# EasyEDA Pro project eda_uahyxtbgs-165w-three-way-multi-protocol-fa-dc91a91e.epro, board PCB_嘉立创8838*150mm铝机壳PCB尺寸15*8.4cm
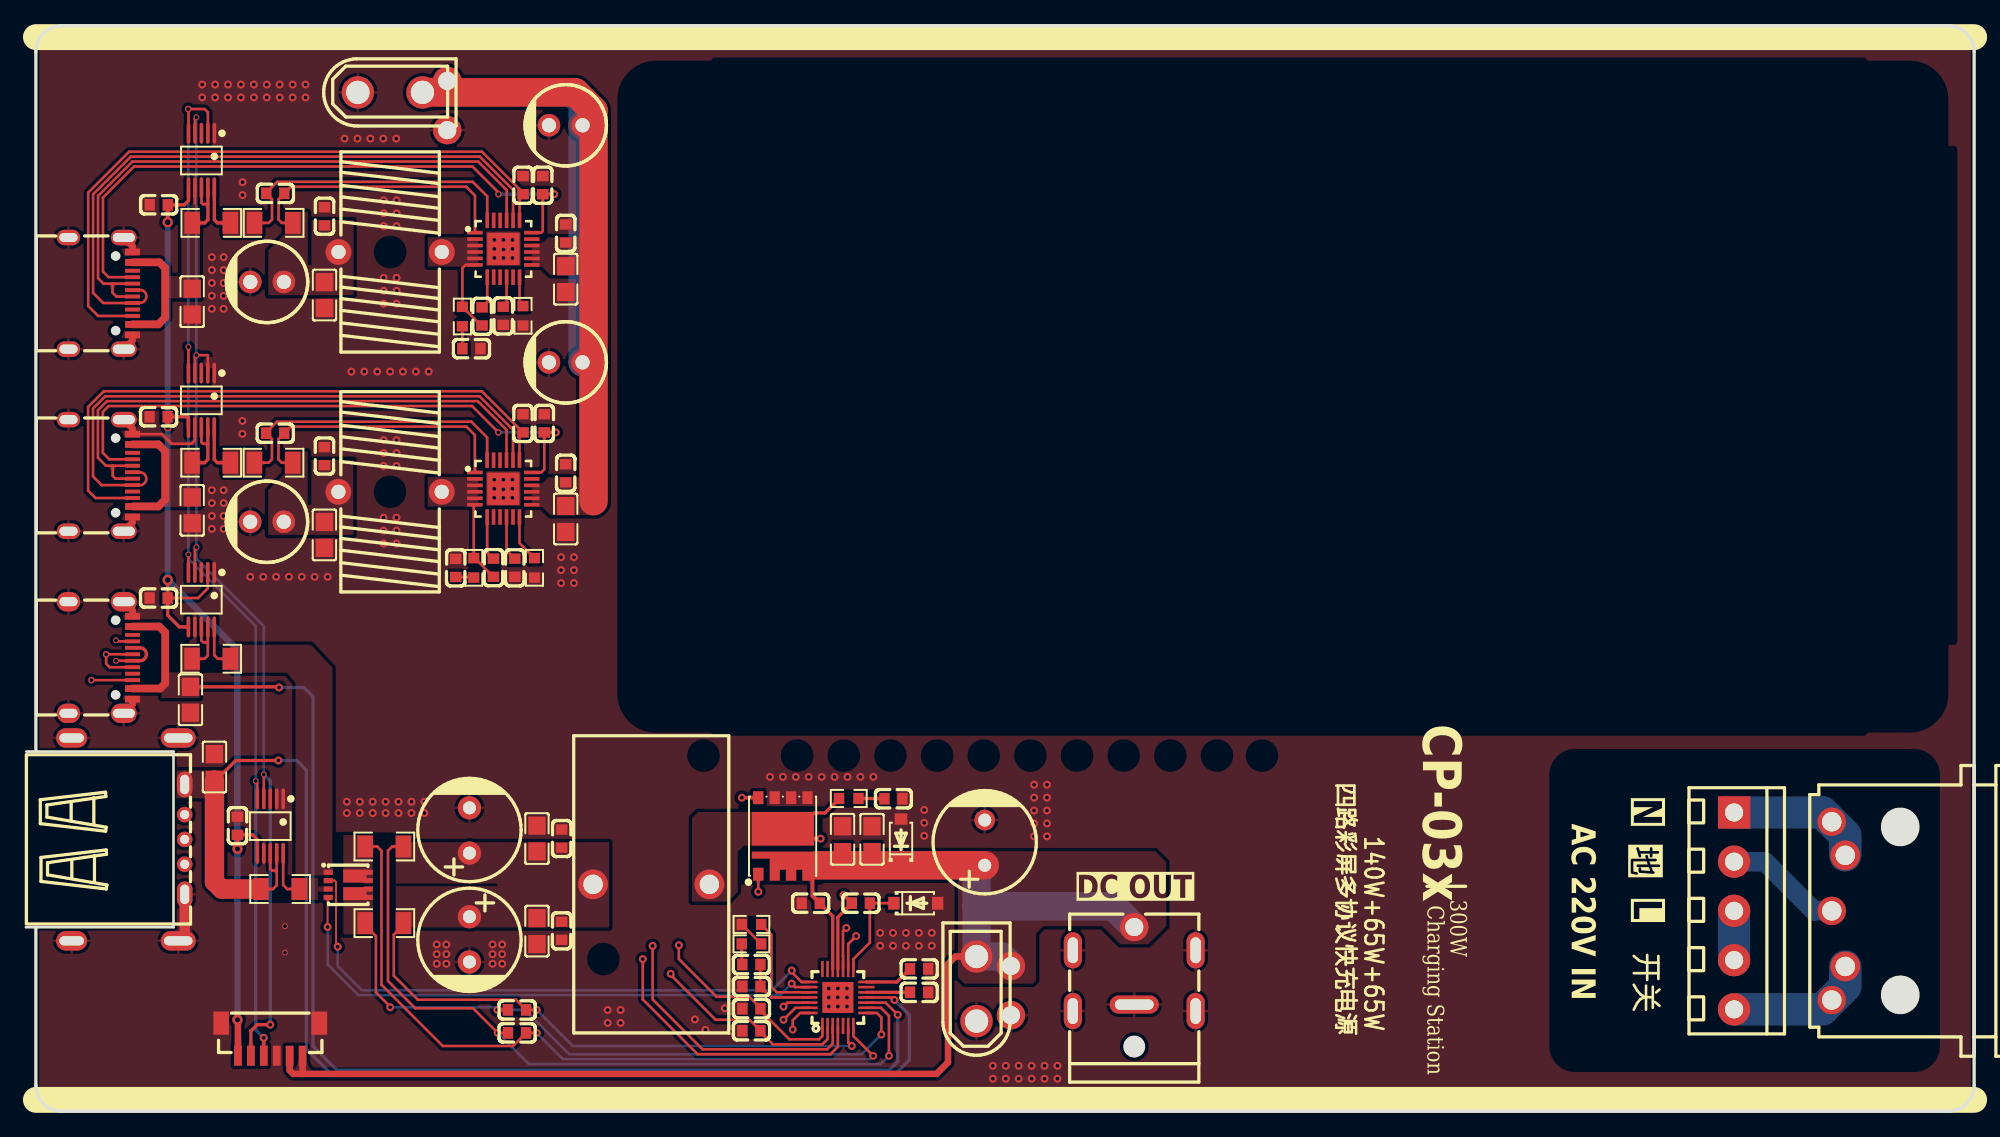
[diagram p4: board, top side]
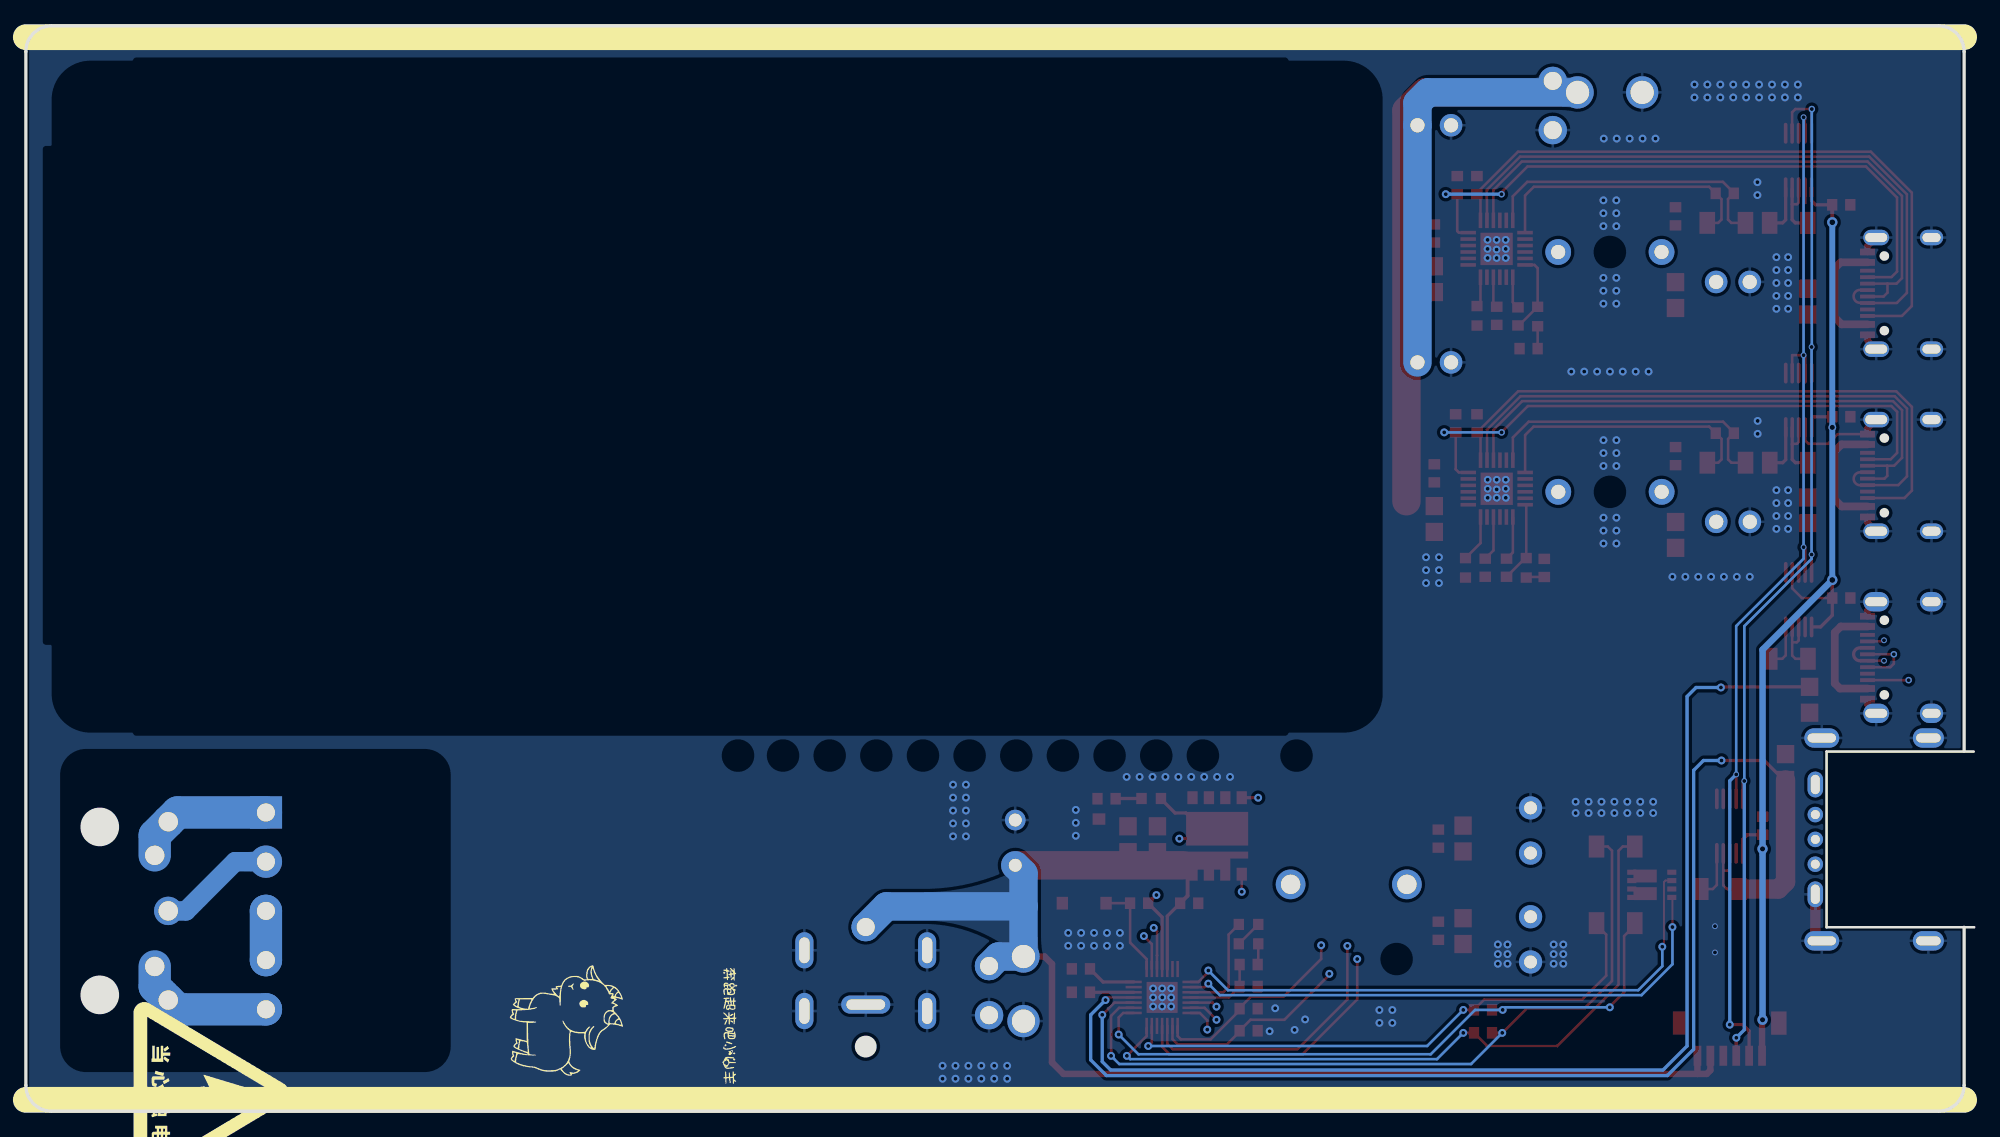
[diagram p5: board, bottom side, seen from below]

Outline 150.78 x 84 mm; copper layers: Top Layer, Inner1, Inner2, Bottom Layer. Coordinates in mm from the lower left corner of the outline.
Outline path: 0.78,27.86 0.78,82 arc(1.36,83.41) 2.78,84 148.78,84 arc(150.19,83.41) 150.78,82 150.78,2 arc(150.19,0.59) 148.78,0 2.78,0 arc(1.36,0.59) 0.78,2 0.78,14.23
Stack: Top Layer 0.035mm 外层铜厚1oz / Dielectric1 0.2104mm 7628 RC49% 8.6mil / Inner1 0.0152mm 内层铜厚 / Dielectric2 1.065mm 1.1mm H/HOZ Copper / Inner2 0.0152mm 内层铜厚 / Dielectric3 0.2104mm 7628 RC49% 8.6mil / Bottom Layer 0.035mm 外层铜厚1oz

## Design rules (mm)
spacing copperThickness1oz: track to track 0.102, other pairs 0.152 to 0.3
spacing copperThickness2oz (default): track to track 0.102, other pairs 0.152 to 0.3
spacing Plane_innerPlane: track to track 0.102, other pairs 0.152 to 0.3
spacing Copper_copperRegion: track to track 0.102, other pairs 0.152 to 0.3
spacing Copper_power: track to track 0.102, other pairs 0.152 to 0.3
track width copperThickness1oz (default): min 0.127, default 0.254, max 6
track width copperThickness2oz: min 0.203, default 0.254, max 2.54
differential pair differentialPair (default): width min 0.127, default 0.254, max 2.54; gap min 0.152, default 0.152
region e1 uses Copper_copperRegion
region e2 uses Copper_copperRegion
region e3 uses Copper_copperRegion
region e4 uses Copper_copperRegion
region e5 uses Copper_copperRegion
region e6 uses Copper_copperRegion
region e7 uses Copper_copperRegion
region e8 uses Copper_copperRegion
region e9 uses Copper_copperRegion
region e10 uses Copper_copperRegion
region e11 uses Copper_copperRegion
region e12 uses Copper_copperRegion
region e13 uses Copper_copperRegion
region e14 uses Copper_copperRegion
region e15 uses Copper_copperRegion
region e16 uses Copper_copperRegion
region e17 uses Copper_copperRegion
region e18 uses Copper_copperRegion
region e19 uses Copper_copperRegion
region e20 uses Copper_copperRegion
region e21 uses Copper_copperRegion
region e22 uses Copper_copperRegion
region e23 uses Copper_copperRegion
region e24 uses Copper_copperRegion
region e25 uses Copper_copperRegion
region e26 uses Copper_copperRegion
region e27 uses Copper_copperRegion
region e28 uses Copper_copperRegion
region e29 uses Copper_copperRegion
region e30 uses Copper_copperRegion
region e31 uses Copper_copperRegion
region e32 uses Copper_copperRegion
region e33 uses Copper_copperRegion
region e34 uses Copper_copperRegion
region e35 uses Copper_copperRegion
region e36 uses Copper_copperRegion
region e37 uses Copper_copperRegion
region e38 uses Copper_copperRegion
region e39 uses Copper_copperRegion
region e40 uses Copper_copperRegion
region e41 uses Copper_copperRegion
region e42 uses Copper_copperRegion
region e43 uses Copper_copperRegion
region e44 uses Copper_copperRegion
region e45 uses Copper_copperRegion
region e46 uses Copper_copperRegion
region e47 uses Copper_copperRegion
region e48 uses Copper_copperRegion
region e49 uses Copper_copperRegion
region e50 uses Copper_copperRegion
region e51 uses Copper_copperRegion
region e52 uses Copper_copperRegion
region e53 uses Copper_copperRegion
region e54 uses Copper_copperRegion
region e55 uses Copper_copperRegion
region e56 uses Copper_copperRegion
region e57 uses Copper_copperRegion
region e58 uses Copper_copperRegion
region e59 uses Copper_copperRegion
region e60 uses Copper_copperRegion
region e61 uses Copper_copperRegion
region e62 uses Copper_copperRegion
region e63 uses Copper_copperRegion
region e64 uses Copper_copperRegion
region e65 uses Copper_copperRegion
region e66 uses Copper_copperRegion
region e67 uses Copper_copperRegion
region e68 uses Copper_copperRegion
region e69 uses Copper_copperRegion
region e70 uses Copper_copperRegion
region e71 uses Copper_copperRegion
region e72 uses Copper_copperRegion
region e73 uses Copper_copperRegion
region e74 uses Copper_copperRegion
region e75 uses Copper_copperRegion
region e76 uses Copper_copperRegion
region e77 uses Copper_copperRegion
region e78 uses Copper_copperRegion
region e79 uses Copper_copperRegion
region e80 uses Copper_copperRegion
region e81 uses Copper_copperRegion
region e82 uses Copper_copperRegion
region e83 uses Copper_copperRegion
region e84 uses Copper_copperRegion
region e85 uses Copper_copperRegion
region e86 uses Copper_copperRegion
region e87 uses Copper_copperRegion
region e88 uses Copper_copperRegion
region e89 uses Copper_copperRegion
region e90 uses Copper_copperRegion
region e91 uses Copper_copperRegion
region e92 uses Copper_copperRegion
region e93 uses Copper_copperRegion
region e94 uses Copper_copperRegion
region e95 uses Copper_copperRegion
region e96 uses Copper_copperRegion
region e97 uses Copper_copperRegion
region e98 uses Copper_copperRegion
region e99 uses Copper_copperRegion
region e100 uses Copper_copperRegion
region e101 uses Copper_copperRegion
region e102 uses Copper_copperRegion
region e103 uses Copper_copperRegion
region e104 uses Copper_copperRegion
region e105 uses Copper_copperRegion
region e106 uses Copper_copperRegion
region e107 uses Copper_copperRegion
region e108 uses Copper_copperRegion
region e109 uses Copper_copperRegion
region e110 uses Copper_copperRegion
region e111 uses Copper_copperRegion
region e112 uses Copper_copperRegion
region e113 uses Copper_copperRegion
region e114 uses Copper_copperRegion
region e115 uses Copper_copperRegion
region e116 uses Copper_copperRegion
region e117 uses Copper_copperRegion
region e118 uses Copper_copperRegion
region e119 uses Copper_copperRegion
region e120 uses Copper_copperRegion
region e121 uses Copper_copperRegion
region e122 uses Copper_copperRegion
region e123 uses Copper_copperRegion
pour e1064 uses Copper_copperRegion
pour e1172 uses Copper_copperRegion
pour e1284 uses Copper_copperRegion

## Placement (name value [footprint] x y rotation side)
C1  100pF  [C0603]  56.15 9.64 180 top
C2  2.2nF  [C0603_4]  56.15 11.35 180 top
C3  100nF  [C0603_1]  60.75 16.09 0 top
C4  22uF  [C0805]  65.48 21.04 270 top
C5  330pF  [C0603]  56.15 7.93 180 top
C6  22uF  [C0805]  41.78 45.83 90 top
C7  330pF  [C0603]  56.15 6.23 180 top
C8  100nF  [C0603_1]  64.62 16.1 180 top
C9  100nF  [C0603_1]  41.47 21.09 270 top
C10  22uF  [C0805]  39.56 21.1 270 top
C11  10uF  [C0805]  14.6 26.63 270 top
C12  1uF  [C0603]  69.13 9.2 180 top
C13  1uF  [C0603]  69.13 11.01 180 top
C14  10uF  [C0805]  12.74 31.84 90 top
C15  100nF  [C0603_1]  38.01 7.84 180 top
C16  100nF  [C0603_1]  38.01 6.06 180 top
C17  330pF  [C0603]  38.47 53.24 90 top
C18  330pF  [C0603]  40.12 53.24 90 top
C19  100nF  [C0603_1]  41.78 49.37 270 top
C20  100nF  [C0603_1]  36.19 42.06 270 top
C21  1uF  [C0603]  37.84 42.06 90 top
C22  2.2nF  [C0603_1]  33.27 42.04 270 top
C23  100nF  [C0603_1]  23.11 50.7 270 top
C24  22uF  [C0805]  23.11 44.6 90 top
C25  100nF  [C0603_1]  19.3 52.47 180 top
C26  10uF  [C0805]  12.87 46.5 90 top
C32  2.2nF  [C0603_4]  67.14 24.18 180 top
C33  22uF  [C0805]  39.56 13.94 90 top
C34  100nF  [C0603_1]  41.47 13.96 90 top
C35  22uF  [C0805]  63.2 21.04 270 top
C36  100nF  [C0603_1]  23.11 69.26 270 top
C37  100nF  [C0603_1]  19.3 71.04 180 top
C38  10uF  [C0805]  12.87 62.65 90 top
C39  100nF  [C0603_1]  35.31 61.51 270 top
C40  1uF  [C0603]  36.95 61.56 90 top
C41  100nF  [C0603_1]  41.78 67.93 270 top
C42  330pF  [C0603]  38.48 71.67 90 top
C43  330pF  [C0603]  40 71.67 90 top
C44  2.2nF  [C0603_1]  34.48 59.02 180 top
C45  22uF  [C0805]  41.78 64.39 90 top
C46  22uF  [C0805]  23.11 63.16 90 top
C47  100nF  [C0603_1]  10.28 53.74 0 top
C48  100nF  [C0603_1]  10.29 70.15 0 top
C49  100nF  [C0603_1]  10.28 39.71 0 top
C50  100nF  [C0603_1]  16.38 22.09 270 top
CN2  DB-6-1P4P3  [CONN-TH_DB-6-1P4P3]  139.76 15.5 90 top
CN3  XT30UPB-M  [CONN-TH_XT30UPB-M]  28.19 78.85 0 top
CN5  DB125-3.81-5P-GN-S  [CONN-TH_DB125-3.81-5P-GN-S]  132.2 15.5 270 top
EC1  220uF  [CAP-TH_BD8.0-P3.50-D0.6-FD-2]  74.21 20.78 90 top
EC2  100uF  [CAP-TH_BD8.0-P3.50-D0.6-FD]  34.33 21.72 90 top
EC3  100uF  [CAP-TH_BD8.0-P3.50-D0.6-FD]  34.33 13.3 270 top
EC4  220uF  [CAP-TH_BD6.3-P2.60-D0.6-FD-1]  41.78 57.95 180 top
EC5  220uF  [CAP-TH_BD6.3-P2.60-D0.6-FD-1]  18.66 45.62 180 top
EC6  220uF  [CAP-TH_BD6.3-P2.60-D0.6-FD-1]  18.67 64.18 180 top
EC7  220uF  [CAP-TH_BD6.3-P2.60-D0.6-FD-1]  41.78 76.3 180 top
J1  U263-163N-4OS1735  [USB-C-SMD_U263-163N-4GS1735]  5.78 35.11 270 top
J2  U224-051N-3GRA035  [USB-A-TH_U224-051N-3GRA035]  7.84 21.03 270 top
J3  U263-163N-4BLS1735  [USB-C-SMD_U263-163N-4GS1735#2]  5.78 49.2 270 top
J4  U263-163N-4BLS1735  [USB-C-SMD_U263-163N-4GS1735#2]  5.78 63.3 270 top
L1  22uH  [IND-TH_L23.0-W12.0-P9.00-D1.3]  48.4 17.55 90 top
L3  22uH  [IND-TH_L15.5-W7.5-P8.00-D0.8]  28.19 47.93 90 top
L4  22uH  [IND-TH_L15.5-W7.5-P8.00-D0.8]  28.19 66.5 90 top
NOREF  -  [Pad_e377]  32.61 79.74 0 top
NOREF#2  -  [Pad_e375]  76.24 11.24 0 top
NOREF#3  -  [Pad_e378]  32.61 75.93 0 top
NOREF#4  -  [Pad_e374]  140.8 11.2 0 top
NOREF#5  -  [Pad_e373]  140.8 19.8 0 top
NOREF#6  -  [Pad_e376]  76.24 7.43 0 top
Q1  RUH30J51M  [DFN-8_L6.0-W5.0-P1.27_AON6938]  58.59 21.3 0 top
Q4  ESN4838  [DFN-8_L3.0-W3.0-P0.65-LS3.4-BL]  24.95 17.52 270 top
R1  20kΩ  [R0603]  56.16 12.95 180 top
R2  SDNT1608X103F3380FTF  [R0603_1]  56.16 14.45 0 top
R7  33kΩ  [R0603]  39.36 42.05 90 top
R8  2Ω  [R0603_1]  34.66 42.05 90 top
R9  5mΩ  [R1206]  27.74 20.48 180 top
R11  5mΩ  [R1206]  27.74 14.55 180 top
R12  10mΩ  [R1206]  19.17 50.19 180 top
R20  2Ω  [R0603_1]  63.69 24.2 180 top
R21  10mΩ  [R1206]  19.18 68.75 180 top
R22  33kΩ  [R0603]  38.47 61.56 90 top
R23  2Ω  [R0603_1]  33.78 61.5 90 top
R24  5mΩ  [R1206]  14.34 50.19 180 top
R25  5mΩ  [R1206]  14.35 68.75 180 top
R26  5mΩ  [R1206]  19.68 17.19 0 top
R27  5mΩ  [R1206]  14.34 35.02 0 top
T1  SMF30A  [SOD-123_L2.6-W1.6-LS3.5-RD]  68.87 16.09 0 top
T2  SMF30A  [SOD-123_L2.6-W1.6-LS3.5-RD]  67.73 20.92 90 top
U1  SW3526  [QFN-24_L4.0-W4.0-P0.50-TL-EP2.5]  36.95 48.18 0 top
U2  SW3538  [QFN-28_L4.0-W4.0-P0.40-TL-EP2.4]  62.84 8.8 90 top
U4  XT30UPB-M  [CONN-TH_XT30UPB-M]  73.57 9.47 90 top
U5  HX DC007B-2.0-J  [DC-IN-TH_HX-DC007B-2.5]  85.78 11 90 top
U7  INA226AIDGSR  [MSOP-10_L3.0-W3.0-P0.50-LS5.0-BL]  18.92 22.06 180 top
U8  INA226AIDGSR  [MSOP-10_L3.0-W3.0-P0.50-LS5.0-BL]  13.58 55.01 180 top
U9  INA226AIDGSR  [MSOP-10_L3.0-W3.0-P0.50-LS5.0-BL]  13.58 39.59 180 top
U10  INA226AIDGSR  [MSOP-10_L3.0-W3.0-P0.50-LS5.0-BL]  13.59 73.58 180 top
U11  SW3526  [QFN-24_L4.0-W4.0-P0.50-TL-EP2.5]  36.96 66.75 0 top
U12  X1002WVS-06E-LPSWHF  [CONN-SMD_6P-P1.00_X1002WVS-06E-LPSWHF]  18.92 5.55 180 top

## Footprints (pads in the part's own frame, mm; a bottom-side part is the same pattern mirrored in y, then rotated)
C0603
  rect 0.8x0.9 smd: 1(-0.7,0) 2(0.7,0)
C0603_1
  rect 0.8x0.9 smd: 1(-0.7,0) 2(0.7,0)
C0603_4
  rect 0.8x0.9 smd: 1(-0.7,0) 2(0.7,0)
C0805
  rect 1.41x1.35 smd: 1(-1,0) 2(1,0)
CAP-TH_BD6.3-P2.60-D0.6-FD-1
  round 1.75 hole 1.1: 1(-1.3,0) 2(1.3,0)
CAP-TH_BD8.0-P3.50-D0.6-FD
  round 1.8 hole 1: 1(-1.75,0) 2(1.75,0)
CAP-TH_BD8.0-P3.50-D0.6-FD-2
  round 1.6 hole 1: 1(-1.75,0) 2(1.75,0)
CONN-SMD_6P-P1.00_X1002WVS-06E-LPSWHF
  rect 0.6x1.55 smd: 1(2.5,1.262) 2(1.5,1.262) 3(0.5,1.262) 4(-0.5,1.262) 5(-1.5,1.262) 6(-2.5,1.262)
  rect 1.2x1.8 smd: 7(-3.8,-1.262) 8(3.8,-1.262)
CONN-TH_DB125-3.81-5P-GN-S
  rect 2.5x2.5 hole 1.4: 1(-7.62,0)
  round 2.5 hole 1.4: 2(-3.81,0) 3(0,0) 4(3.81,0) 5(7.62,0)
CONN-TH_DB-6-1P4P3
  round 2.2 hole 1.5: 1(-6.9,0) 2(0,0) 3(6.9,0)
CONN-TH_XT30UPB-M
  round 2.5 hole 1.8: 1(-2.5,0) 2(2.5,0)
DC-IN-TH_HX-DC007B-2.5
  round 2.2 hole 1.4: 1(3.25,0)
  oval 1.4x3.8 hole 0.8x3: 2(-2.75,0)
  oval 2.8x1.4 hole 2x0.8: 3(-3.25,4.75) 3(-3.25,-4.75) 3(1.45,4.75) 3(1.45,-4.75)
DFN-8_L3.0-W3.0-P0.65-LS3.4-BL
  rect 0.4x0.7 smd: 1(-0.975,-1.55) 2(-0.325,-1.55) 3(0.325,-1.55) 4(0.975,-1.55) 5(0.975,1.55) 6(0.325,1.55) 7(-0.325,1.55) 8(-0.975,1.55)
  rect 1x1.8 smd: 6(0.68,0.515) 8(-0.68,0.515)
DFN-8_L6.0-W5.0-P1.27_AON6938
  rect 0.8x1 smd: 1(-1.905,-2.96) 3(1.905,2.96) 4(0.635,2.96) 5(-0.635,2.96) 6(-1.905,2.96)
  custom 4.8x2.25 smd: 2(-0.005,-1.91)
  rect 4.8x2.6 smd: 7(0,0.56)
IND-TH_L15.5-W7.5-P8.00-D0.8
  round 2 hole 1.1: 1(0,-4) 2(0,4)
IND-TH_L23.0-W12.0-P9.00-D1.3
  round 2.3 hole 1.5: 1(0,-4.5) 2(0,4.5)
MSOP-10_L3.0-W3.0-P0.50-LS5.0-BL
  oval 0.28x1.62 smd: 1(-1,-2.11) 2(-0.5,-2.11) 3(0,-2.11) 4(0.5,-2.11) 5(1,-2.11) 6(1,2.11) 7(0.5,2.11) 8(0,2.11) 9(-0.5,2.11) 10(-1,2.11)
Pad_e373
  round 2.3 hole 1.5: 1(0,0)
Pad_e374
  round 2.3 hole 1.5: 1(0,0)
Pad_e375
  round 2.2 hole 1.4: 1(0,0)
Pad_e376
  round 2.2 hole 1.4: 1(0,0)
Pad_e377
  round 2.2 hole 1.4: 1(0,0)
Pad_e378
  round 2.2 hole 1.4: 1(0,0)
QFN-24_L4.0-W4.0-P0.50-TL-EP2.5
  rect 1.2x0.28 smd: 1(-2.2,1.25) 2(-2.2,0.75) 3(-2.2,0.25) 4(-2.2,-0.25) 5(-2.2,-0.75) 6(-2.2,-1.25) 13(2.2,-1.25) 14(2.2,-0.75) 15(2.2,-0.25) 16(2.2,0.25) 17(2.2,0.75) 18(2.2,1.25)
  rect 0.28x1.2 smd: 7(-1.25,-2.2) 8(-0.75,-2.2) 9(-0.25,-2.2) 10(0.25,-2.2) 11(0.75,-2.2) 12(1.25,-2.2) 19(1.25,2.2) 20(0.75,2.2) 21(0.25,2.2) 22(-0.25,2.2) 23(-0.75,2.2) 24(-1.25,2.2)
  rect 2.5x2.5 smd: 25(-0.001,-0.013)
QFN-28_L4.0-W4.0-P0.40-TL-EP2.4
  rect 1.25x0.2 smd: 1(-2.2,1.2) 2(-2.2,0.8) 3(-2.2,0.4) 4(-2.2,0.001) 5(-2.2,-0.4) 6(-2.2,-0.8) 7(-2.2,-1.2) 15(2.2,-1.2) 16(2.2,-0.8) 17(2.2,-0.4) 18(2.2,0) 19(2.2,0.4) 20(2.2,0.8) 21(2.2,1.2)
  rect 0.2x1.25 smd: 8(-1.2,-2.2) 9(-0.8,-2.2) 10(-0.4,-2.2) 11(0,-2.2) 12(0.4,-2.2) 13(0.8,-2.2) 14(1.2,-2.2) 22(1.2,2.2) 23(0.8,2.2) 24(0.4,2.2) 25(0,2.2) 26(-0.4,2.2) 27(-0.8,2.2) 28(-1.2,2.2)
  rect 2.4x2.4 smd: 29(0,-0.001)
R0603
  rect 0.806x0.864 smd: 1(-0.753,0) 2(0.753,0)
R0603_1
  rect 0.806x0.864 smd: 1(-0.753,0) 2(0.753,0)
R1206
  rect 1.208x1.701 smd: 1(-1.479,0) 2(1.479,0)
SOD-123_L2.6-W1.6-LS3.5-RD
  rect 0.88x0.99 smd: 1(-1.692,0) 2(1.692,0)
USB-A-TH_U224-051N-3GRA035
  oval 2x1.2 hole 1.5x0.7: 1(-4.25,4.45) 5(4.25,4.45)
  round 1.2 hole 0.7: 2(-1.92,4.45) 3(0,4.45) 4(1.92,4.45)
  oval 1.5x2.7 hole 0.7x2.2: 6(-7.85,3.95) 7(7.85,3.95)
  oval 1.5x2.4 hole 0.7x1.9: 8(-7.85,-4.3) 9(7.85,-4.3)
USB-C-SMD_U263-163N-4GS1735
  rect 0.5x1.15 smd: A1(-3.2,2.478) A4(-2.4,2.478) A9(2.4,2.478) A12(3.219,2.478) B1(3.219,2.478) B4(2.4,2.478) B9(-2.4,2.478) B12(-3.2,2.478)
  rect 0.3x1.15 smd: A5(-1.25,2.478) A6(-0.25,2.478) A7(0.25,2.478) A8(1.25,2.478) B5(1.75,2.478) B6(0.75,2.478) B7(-0.75,2.478) B8(-1.75,2.478)
  oval 1.5x2 hole 0.7x1.7: SH1(-4.32,1.802) SH1(4.32,1.802)
  oval 1.5x1.8 hole 0.7x1.4: SH1(-4.32,-2.478) SH1(4.32,-2.478)
USB-C-SMD_U263-163N-4GS1735#2
  rect 0.5x1.15 smd: A1(-3.2,2.478) A4(-2.4,2.478) A9(2.4,2.478) A12(3.219,2.478) B1(3.219,2.478) B4(2.4,2.478) B9(-2.4,2.478) B12(-3.2,2.478)
  rect 0.3x1.15 smd: A5(-1.25,2.478) A6(-0.25,2.478) A7(0.25,2.478) A8(1.25,2.478) B5(1.75,2.478) B6(0.75,2.478) B7(-0.75,2.478) B8(-1.75,2.478)
  oval 1.2x2 hole 0.7x1.7: SH1(-4.32,1.802) SH1(4.32,1.802)
  oval 1.2x1.8 hole 0.7x1.4: SH1(-4.32,-2.478) SH1(4.32,-2.478)

## Nets
As in the schematic, except:
GND: C1.2 C3.1 C4.1 C5.2 C6.1 C7.2 C9.1 C10.1 C11.1 C12.1 C13.1 C14.1 C17.2 C18.2 C19.1 C21.1 C22.1 C23.1 C24.1 C26.1 C32.1 C33.1 C34.1 C35.1 C36.1 C38.1 C40.1 C41.1 C42.2 C43.2 C44.1 C45.1 C46.1 C47.1 C48.1 C49.1 C50.1 CN3.1 EC1.2 EC2.2 EC3.2 EC4.2 EC5.2 EC6.2 EC7.2 J1.A1 J1.A12 J1.B1 J1.B12 J1.SH1 J2.5 J2.6 J2.7 J2.8 J2.9 J3.A1 J3.A12 J3.B1 J3.B12 J3.SH1 J4.A1 J4.A12 J4.B1 J4.B12 J4.SH1 NOREF#3.1 NOREF#6.1 Q1.3 Q1.4 Q1.5 R1.1 R2.1 R7.1 R22.1 T1.2 T2.2 U1.25 U2.29 U4.1 U5.2 U5.3 U7.1 U7.2 U7.7 U8.1 U8.7 U9.1 U9.7 U10.1 U10.7 U11.25 U12.4 U12.7 U12.8
VIN: C3.2 C4.2 C35.2 EC1.1 NOREF#2.1 Q1.2 T2.1 U2.19 U4.2 U5.1 U12.5 U12.6
VIN2: C6.2 C19.2 C41.2 C45.2 CN3.2 EC4.1 EC7.1 NOREF.1 U1.13 U1.14 U1.15 U1.16 U11.13 U11.14 U11.15 U11.16
LIN: CN2.1 CN5.5 NOREF#4.1
N: CN2.3 CN5.1 NOREF#5.1

Pads without a net: J1 A8 B8; J3 A8 B8; J4 A8 B8; U1 8 9 11 17 22 23; U2 5 13 20 21; U7 3; U8 3; U9 3; U10 3; U11 8 9 11 17 22 23

## Via types
v1: diameter 0.61, hole 0.305, Top Layer to Bottom Layer, 228 vias
v2: diameter 0.45, hole 0.305, Top Layer to Bottom Layer, 11 vias
v3: diameter 0.508, hole 0.305, Top Layer to Bottom Layer, 5 vias
v4: diameter 0.8, hole 0.45, Top Layer to Bottom Layer, 2 vias
v5: diameter 0.8, hole 0.4, Top Layer to Bottom Layer, 2 vias
v6: diameter 0.6, hole 0.4, Top Layer to Bottom Layer, 1 via

## Routing (per net, layer and track width the routed paths; a pad name or vN(x,y) marks a point on that pad's centre or on a via; arc(x,y) is an arc through that point)
3V3: length 87.3
  Top Layer w0.2: 10.98,39.71 13.33,39.71 14.08,40.47 U9.2
  Top Layer w0.254: 10.98,53.74 12.51,53.74 12.58,53.67 U8.6 ; U9.6 11.88,37.48 10.98,38.38 v4(10.98,41.11) ; U7.6 17.92,21.03 17.55,21.39 C50.2 ; C48.2 12.26,70.15 12.59,70.47 U10.6
  Top Layer w0.3: C50.2 16.38,21.39 v5(16.38,20.3) ; v4(10.98,68.8) 10.99,68.8 C48.2 ; v6(10.98,52.92) 10.98,53.74
  Top Layer w0.5: U12.1 16.42,7.03 16.38,7.07
  Bottom Layer w0.45: v4(10.98,68.8) v6(10.98,52.92) v4(10.98,41.11)
  Bottom Layer w0.5: v4(10.98,41.11) 16.38,35.72 16.38,20.3 v5(16.38,20.3) 16.38,7.08 16.38,7.07
  vias: v5(16.38,7.07)
GND: length 21.7
  Top Layer w0.2: 13.07,70.28 13.07,71.45 U10.7 ; R2.1 56.9,12.95 R1.1 ; J3.A1 10.54,52.4 11.3,51.65 12.82,51.65 13.08,51.91 U8.7
  Top Layer w0.5: J1.SH1 8.26,38.75 J1.A1 ; J1.A12 8.26,31.47 J1.SH1 ; J4.SH1 8.26,59.65 J4.A12 ; J3.A12 8.26,45.56 J3.SH1 ; J3.SH1 8.26,52.85 J3.A1 ; J4.A1 8.26,66.94 J4.SH1
  Top Layer w0.8: J2.5 12.29,13.68 J2.7
  vias: v1(13.65,79.46) v1(13.65,78.46) v1(14.4,66.1) v1(14.4,65.1) v1(14.4,64.1) v1(14.4,63.1) v1(14.4,62.1) v1(14.4,48.06) v1(14.4,47.06) v1(14.4,46.06) v1(14.4,45.06) v1(14.65,79.46) v1(14.65,78.46) v1(15.31,66.1) v1(15.31,65.1) v1(15.31,64.1) v1(15.31,63.1) v1(15.31,62.1) v1(15.31,48.06) v1(15.31,47.06) v1(15.31,46.06) v1(15.31,45.06) v1(15.65,79.46) v1(15.65,78.46) v1(16.65,79.46) v1(16.65,78.46) v1(16.77,71.9) v1(16.77,70.9) v1(16.76,53.42) v1(16.76,52.42) v1(17.37,41.36) v1(17.65,79.46) v1(17.65,78.46) v1(18.37,41.36) v1(18.65,79.46) v1(18.65,78.46) v1(19.37,41.36) v1(19.65,79.46) v1(19.65,78.46) v1(20.36,41.36) v1(20.65,79.46) v1(20.65,78.46) v1(21.35,41.36) v1(21.65,79.46) v1(21.65,78.46) v1(22.35,41.36) v1(23.35,41.36) v1(24.66,75.27) v1(24.84,23.95) v1(24.84,23.07) v1(25.19,57.24) v1(25.66,75.27) v1(25.84,23.95) v1(25.84,23.07) v1(26.19,57.24) v1(26.66,75.27) v1(26.84,23.95) v1(26.84,23.07) v1(27.19,57.24) v1(27.66,75.27) v1(27.69,70.5) v1(27.69,69.5) v1(27.69,68.5) v1(27.69,64.5) v1(27.69,63.5) v1(27.69,62.5) v1(27.69,51.93) v1(27.69,50.93) v1(27.69,49.93) v1(27.69,45.93) v1(27.69,44.93) v1(27.69,43.93) v1(27.84,23.95) v1(27.84,23.07) v1(28.19,57.24) v1(28.66,75.27) v1(28.69,70.5) v1(28.69,69.5) v1(28.69,68.5) v1(28.69,64.5) v1(28.69,63.5) v1(28.69,62.5) v1(28.69,51.93) v1(28.69,50.93) v1(28.69,49.93) v1(28.69,45.93) v1(28.69,44.93) v1(28.69,43.93) v1(28.84,23.95) v1(28.84,23.07) v1(29.18,57.24) v1(29.84,23.95) v1(29.84,23.07) v1(30.18,57.24) v1(30.84,23.95) v1(30.84,23.07) v1(31.18,57.24) v1(31.8,12.9) v1(31.8,12.16) v1(31.8,11.41) v1(32.54,12.9) v1(32.54,12.16) v1(32.54,11.41) v1(36.12,12.9) v1(36.12,12.16) v1(36.12,11.41) v1(36.26,67.43) v1(36.26,66.73) v1(36.26,66.03) v1(36.25,48.87) v1(36.25,48.17) v1(36.25,47.47) v1(36.86,12.9) v1(36.86,12.16) v1(36.86,11.41) v1(36.96,67.43) v1(36.96,66.68) v1(36.96,66.03) v1(36.95,48.87) v1(36.95,48.12) v1(36.95,47.47) v1(37.66,67.43) v1(37.66,66.73) v1(37.66,66.03) v1(37.65,48.87) v1(37.65,48.17) v1(37.65,47.47) v1(41.42,42.87) v1(41.42,41.87) v1(41.42,40.87) v1(42.42,42.87) v1(42.42,41.87) v1(42.42,40.87) v1(45.03,7.83) v1(45.03,6.83) v1(46.03,7.83) v1(46.03,6.83) v1(51.78,7.1) v1(52.59,6.29) v1(54.09,7.96) v1(54.52,6.19) v1(57.59,25.87) v1(58.59,25.87) v1(59.59,25.87) v1(60.59,25.87) v1(61.59,25.87) v1(62.14,9.5) v1(62.14,8.8) v1(62.14,8.1) v1(62.59,25.87) v1(62.84,9.5) v1(62.83,8.81) v1(62.84,8.1) v1(63.59,25.87) v1(63.54,9.5) v1(63.54,8.8) v1(63.54,8.1) v1(64.59,25.87) v1(65.59,25.87) v1(66.11,13.8) v1(66.11,12.8) v1(67.11,13.8) v1(67.11,12.8) v1(68.11,13.8) v1(68.11,12.8) v1(69.11,13.8) v1(69.11,12.8) v1(69.52,23.31) v1(69.52,22.31) v1(69.52,21.31) v1(70.11,13.8) v1(70.11,12.8) v1(74.83,3.51) v1(74.83,2.51) v1(75.83,3.51) v1(75.83,2.51) v1(76.83,3.51) v1(76.83,2.51) v1(77.83,3.51) v1(77.83,2.51) v1(78.03,25.27) v1(78.03,24.27) v1(78.03,23.27) v1(78.03,22.27) v1(78.03,21.27) v1(78.83,3.51) v1(78.83,2.51) v1(79.03,25.27) v1(79.03,24.27) v1(79.03,23.27) v1(79.03,22.27) v1(79.03,21.27) v1(79.83,3.51) v1(79.83,2.51) v2(20.06,14.31) v2(20.06,12.28)
PGND: length 9.1
  Bottom Layer w1.5: CN2.2 138.38,15.5 134.57,19.31 CN5.2
VBUSA1: length 101.6
  Top Layer w0.2: U2.11 67.02,8.8 v1(67.22,8.6) ; U7.8 18.92,18.76 19.05,18.62 19.42,18.62 ; 19.42,18.62 19.42,17.48 19.13,17.19 R26.1 ; 19.42,18.62 U7.9
  Top Layer w0.254: C11.2 14.74,25.63 16.25,27.14 v1(19.55,27.14)
  Top Layer w1.5: C11.2 14.6,17.74 15.15,17.19 17.52,17.19
  Bottom Layer w0.254: v1(67.22,8.6) 68.37,7.45 68.37,3.97 67.16,2.76 23.74,2.76 21.71,4.79 21.71,26.38 20.95,27.14 v1(19.55,27.14)
VBUSC: length 14.7
  Top Layer w0.2: U8.8 13.58,51.78 13.71,51.65 14.05,51.65 14.08,51.62
  Top Layer w0.254: U8.9 14.08,50.43 13.84,50.19 R24.2
  Top Layer w0.6: J3.A4 10.26,51.6 10.79,51.08 10.79,47.33 10.26,46.8 J3.A9
VBUSC1: length 104.1
  Top Layer w0.2: v1(67.48,7.46) 66.53,8.4 U2.10 ; 14.08,36.28 13.72,36.28 13.58,36.43 U9.8 ; 14.08,36.28 U9.9 ; 14.08,36.28 14.08,35.26 13.84,35.02 R27.1
  Top Layer w0.254: v1(19.59,32.79) 19.55,32.84 C14.2
  Top Layer w0.6: J1.A9 10.39,32.71 10.79,33.11 10.79,37.05 10.32,37.51 J1.A4
  Bottom Layer w0.254: v1(19.59,32.79) 21.52,32.79 22.22,32.09 22.22,5.04 24.07,3.19 66.83,3.19 67.48,3.83 v1(67.48,7.46)
VBUSC2: length 14.6
  Top Layer w0.2: 14.09,70.19 13.71,70.19 13.59,70.31 U10.8
  Top Layer w0.254: 14.09,71.34 14.09,69 13.84,68.75 12.87,68.75
  Top Layer w0.6: J4.A9 10.25,60.9 10.79,61.43 10.79,65.25 10.34,65.7 J4.A4
VDD1: length 3.4
  Top Layer w0.254: U2.12 C12.2
VIN: length 108
  Top Layer w0.254: U2.19 62.44,15.09 C3.2
  Top Layer w0.3: C3.2 60.87,16.66 60.87,18.12
  Top Layer w0.5: U12.6 21.42,2.88 ; 21.42,2.88 70.48,2.88 71.37,3.77 71.37,11.39 71.94,11.97 U4.2 ; 21.42,2.88 20.69,2.88 20.42,3.16 U12.5
  Top Layer w2.2: 61.21,19.03 EC1.1
  Bottom Layer w2.2: U5.1 84.18,15.85 73.57,15.85 ; EC1.1 73.57,18.39 73.57,15.85 ; 73.57,15.85 U4.2 75.5,11.97 NOREF#2.1
VIN2: length 76.9
  Top Layer w2.2: CN3.2 42.52,78.85 43.93,77.43 43.93,47.21
  Bottom Layer w2.2: CN3.2 42.26,78.85 43.08,78.03 EC7.1 EC4.1
$C2_2: length 1.6
  Top Layer w0.2: C2.2 55.4,11.39 R1.2
$C13_2: length 3.8
  Top Layer w0.254: U2.14 67.42,10 C13.2
$C20_1: length 3.4
  Top Layer w0.2: C20.1 35.7,43.25 U1.7
$C22_2: length 1.4
  Top Layer w0.2: 34.66,41.3 34.62,41.34 C22.2
$C32_2: length 2
  Top Layer w0.254: R20.1 66.42,24.2 C32.2
$C39_1: length 2.5
  Top Layer w0.2: U11.7 35.71,62.61 C39.1
$C44_2: length 1.7
  Top Layer w0.2: R23.1 C44.2
$Q4_1: length 3.5
  Top Layer w0.2: U9.10 14.58,35.28 14.85,35.02 R27.2
$Q4_3: length 3.8
  Top Layer w0.2: R26.2 20.23,17.19 19.92,17.5 U7.10
$R7_2: length 3.7
  Top Layer w0.2: R7.2 38.2,43.97 38.2,45.98
$R22_2: length 2.3
  Top Layer w0.2: U11.12 38.21,62.58 R22.2
BST1: length 7.5
  Top Layer w0.2: T1.1 67.18,16.1 65.32,16.1 65.32,13.04 64.04,11.77 U2.15
CC1: length 46.6
  Top Layer w0.2: J3.A5 6.46,50.45 5.96,50.95 5.96,54.12 6.41,54.57 34.54,54.57 36.57,52.54 36.57,52.47 ; C18.1 40.12,49.68 39.88,49.43 U1.18
  Top Layer w0.254: v1(41.01,52.54) C18.1
  Bottom Layer w0.2: v3(36.57,52.54) v1(41.01,52.54)
CC1-2: length 49.7
  Top Layer w0.2: v3(36.58,70.97) 36.58,71.1 34.56,73.11 8.37,73.11 5.97,70.71 5.97,64.98 6.38,64.57 ; U11.18 39.89,68 40,68.11 C43.1 ; J4.A5 6.4,64.55
  Top Layer w0.254: v1(40.89,70.97) C43.1
  Bottom Layer w0.254: v3(36.58,70.97) v1(40.89,70.97)
CC1_1: length 78.1
  Top Layer w0.2: U2.2 62.04,5.58 61.63,5.17 57.82,5.17 56.85,6.15 C7.1 ; v2(6.98,36.44) 7.06,36.36 J1.A5
  Top Layer w0.203: v1(49.9,10.63) 49.9,10.55 53.38,7.07 56,7.07 C7.1
  Inner2 w0.2: v2(6.98,36.44) 7.09,36.56 36.55,36.56 49.9,23.2 v1(49.9,10.63)
CC2: length 47.9
  Top Layer w0.2: 38.2,50.38 38.2,52.27 38.47,52.54 C17.1 35.29,55.72 6.03,55.72 4.82,54.51 4.82,48.03 5.39,47.45 J3.B5
CC2-2: length 51.1
  Top Layer w0.2: J4.B5 5.59,61.55 ; U11.19 38.21,70.83 38.35,70.97 C42.1 38.48,71.08 35.3,74.26 7.99,74.26 4.83,71.09 4.83,62.31 5.57,61.57
CC2_1: length 83.8
  Top Layer w0.2: J1.B5 v3(5.07,33.36) ; U2.1 61.64,5.81 61.39,5.56 59.09,5.56 56.85,7.8 C5.1 56.85,7.98 55.98,8.85 53.46,8.85 50.53,11.78 v1(50.53,12.84)
  Inner2 w0.2: v1(50.53,12.84) 50.53,23.34 36.82,37.05 5.83,37.05 5.07,36.28 v3(5.07,33.36)
COMP1: length 5.8
  Top Layer w0.2: U2.25 57.69,8.8 C1.1 C2.1
CSN: length 27.3
  Top Layer w0.2: R12.2 18.79,50.19 19.04,50.44 19.04,52.03 C25.2 18.6,52.52 19.44,53.36 34.48,53.36 35.7,52.14 U1.24
  Top Layer w0.254: U8.10 14.58,50.43 14.82,50.19 R24.1
CSN2: length 27.3
  Top Layer w0.2: R21.2 18.8,68.75 19.05,69 19.05,70.59 C37.2 18.6,71.09 19.44,71.92 34.58,71.92 35.71,70.8 U11.24
  Top Layer w0.254: U10.10 14.59,68.99 14.83,68.75 R25.1
CSNA1: length 50.9
  Top Layer w0.2: U2.8 65.86,7.6 66.21,7.25 v1(66.21,5.93) ; 26.27,14.55 26.27,14.38 27.09,13.55 27.09,9.2 28.19,8.09 v1(28.19,8.04)
  Top Layer w0.254: v1(36.49,7.84) C15.2
  Bottom Layer w0.2: v1(28.19,8.04) 36.29,8.04 v1(36.49,7.84) 38.62,7.84 42.05,4.41 64.68,4.41 v1(66.21,5.93)
CSNC1: length 55.9
  Top Layer w0.2: 64.04,6.44 64.04,5.81 v1(65.57,4.28) ; R9.2 27.19,20.48 27.52,20.16 27.52,9.79 32.27,5.04 37.7,5.04 C16.1 v1(39.54,6.06)
  Bottom Layer w0.2: v1(39.54,6.06) 41.57,4.03 65.32,4.03 v1(65.57,4.28)
CSP: length 21.5
  Top Layer w0.2: R12.1 19.8,50.19 19.55,50.44 19.55,52.03 C25.1 20.5,52.98 34.09,52.98 34.75,52.33 U1.1
CSP2: length 21.5
  Top Layer w0.2: R21.1 19.81,68.75 19.56,69 19.56,70.59 C37.1 20.51,71.54 34.08,71.54 34.76,70.86 U11.1
CSPA1: length 102.8
  Top Layer w0.2: U2.9 66.17,8 66.79,7.38 v1(66.79,4.28) ; R9.1 28.35,20.48 28.03,20.16 28.03,10.07 30.14,7.96 34.61,7.96 v1(36.52,6.06) C16.2 ; U2.6 63.64,5.32 v1(63.92,5.04) ; R11.1 29.22,14.41 28.48,13.67 28.48,10.48 30.33,8.63 37.92,8.63 C15.1 v1(39.54,7.84)
  Bottom Layer w0.2: v1(36.52,6.06) 38.93,3.65 66.16,3.65 v1(66.79,4.28) ; v1(63.92,5.04) 42.33,5.04 v1(39.54,7.84)
DMA1: length 57.4
  Top Layer w0.2: U2.28 59.92,7.6 59.35,7.03 v1(59.35,6.31)
  Inner2 w0.2: J2.2 25.76,9.49 58.16,9.49 59.35,8.3 v1(59.35,6.31)
DMC: length 44.2
  Top Layer w0.2: J3.A7 6.94,48.95 6.72,49.17 6.72,49.95 6.73,49.95 ; 37.2,50.38 37.2,52.73 34.98,54.95 6.28,54.95 5.58,54.25 5.58,50.57 6.2,49.95 6.73,49.95 ; 6.73,49.95 J3.B7
DMC2: length 47.6
  Top Layer w0.2: J4.A7 7.01,63.05 6.71,63.35 6.71,64.05 ; U11.21 37.21,71.29 35,73.5 8.25,73.5 5.59,70.84 5.59,64.47 6.01,64.05 6.71,64.05 ; 6.71,64.05 J4.B7
DMC_1: length 81.4
  Top Layer w0.2: v2(6.98,34.86) J1.A7
  Top Layer w0.203: U2.4 62.84,4.98 62.27,4.41 51.98,4.41 47.74,8.65 v1(47.74,11.77)
  Top Layer w0.254: 8.83,35.86 arc(9.33,35.36) 8.83,34.86
  Inner2 w0.2: v1(47.74,11.77) 47.74,22.7 35.58,34.86 v2(6.98,34.86)
DPA1: length 53.7
  Top Layer w0.2: U2.27 59.56,8 v1(58.63,7.07)
  Inner2 w0.2: J2.4 22.68,8.73 56.98,8.73 v1(58.63,7.07)
DPC: length 46.5
  Top Layer w0.2: J3.B6 5.87,48.45 5.2,49.13 5.2,54.38 6.16,55.34 35.1,55.34 37.7,52.74 U1.20
  Top Layer w0.203: 8.82,49.45 arc(9.32,48.95) 8.82,48.45
DPC2: length 49.7
  Top Layer w0.2: U11.20 37.71,71.3 35.13,73.88 8.12,73.88 5.21,70.96 5.21,63.33 5.96,62.57 ; J4.B6 5.99,62.55
  Top Layer w0.203: 8.83,63.56 arc(9.33,63.06) 8.83,62.56
DPC_1: length 83.6
  Top Layer w0.2: J1.B6 6.49,34.36 6.22,34.63 v3(6.22,35.36) J1.A6 ; v1(48.51,12.79) 48.51,8.65 52.36,4.79 62.02,4.79 62.44,5.22 U2.3
  Inner2 w0.2: v1(48.51,12.79) 48.51,22.67 35.81,35.36 v3(6.22,35.36)
GATEA1: length 43.9
  Top Layer w0.152: v1(23.35,14.25) 23.35,16.54
  Top Layer w0.2: v1(59.27,9.87) 59.54,9.6 U2.23
  Bottom Layer w0.2: v1(59.27,9.87) 58.38,8.98 25.74,8.98 23.35,11.37 v1(23.35,14.25)
GATEC1: length 45.7
  Top Layer w0.152: 23.32,17.84 23.33,17.85 23.89,17.85 24.01,17.73 24.01,12.86 24.14,12.73
  Top Layer w0.2: U2.22 60.03,10 59.27,10.76 v1(59.27,10.88)
  Bottom Layer w0.2: v1(24.14,12.73) 24.14,11.22 26,9.36 57.75,9.36 v1(59.27,10.88)
HGATE1: length 12.9
  Top Layer w0.2: v1(63.49,14.19) 63.24,13.93 63.24,12.05 63.24,12.04 U2.17 ; v1(56.68,16.98) Q1.1
  Inner2 w0.2: v1(63.49,14.19) 59.05,14.19 56.68,16.55 v1(56.68,16.98)
IDA1: length 53.8
  Top Layer w0.2: U2.26 58.94,8.4 v1(58.63,8.09)
  Inner2 w0.2: v1(58.63,8.09) 57.62,9.11 24.22,9.11 J2.3
L: length 3.8
  Bottom Layer w2.5: CN5.3 CN5.4
LGATE1: length 21.7
  Top Layer w0.2: U2.16 63.64,12.94 v1(64.25,13.55)
  Top Layer w0.254: v1(55.41,24.26) Q1.6
  Inner2 w0.2: v1(64.25,13.55) 58.67,13.55 55.87,16.35 55.87,23.8 v1(55.41,24.26)
LIN: length 10.9
  Bottom Layer w2.5: CN5.5 139.04,7.88 CN2.1 140.8,9.65 NOREF#4.1
N: length 10.9
  Bottom Layer w2.5: NOREF#5.1 140.8,21.35 CN2.3 139.04,23.12 CN5.1
NTC1: length 8.3
  Top Layer w0.2: R2.2 57.7,13.66 57.7,9.62 58.11,9.2 U2.24
SCL: length 85.7
  Top Layer w0.2: v2(12.58,43.08) U9.5 ; U10.2 14.09,77.31 13.84,77.56 v3(12.57,77.56) 12.59,77.54 U10.5 12.57,75.71 ; U7.5 17.92,25.43 v2(17.79,25.55) ; U8.5 v2(12.58,59.14)
  Top Layer w0.254: v1(18.41,5.68) 18.42,5.67 U12.3
  Inner2 w0.2: 12.57,59.16 v2(12.58,59.14)
  Bottom Layer w0.2: v2(17.79,25.55) 17.79,37.54 12.58,42.75 v2(12.58,43.08) v2(12.58,59.14) ; v3(12.57,77.56) 12.57,59.16
  Bottom Layer w0.254: v2(17.79,25.55) 17.79,6.3 v1(18.41,5.68)
SDA: length 85.1
  Top Layer w0.2: v2(13.2,43.65) 13.08,43.53 U9.4 ; U10.4 13.09,76.81 v2(13.2,76.92) ; v2(18.42,26.06) U7.4 ; U8.4 13.08,58.39 v2(13.2,58.51) 14.09,58.51 14.09,57.13 U8.2
  Top Layer w0.254: U12.2 17.42,6.21 17.9,6.69 v1(18.92,6.69)
  Bottom Layer w0.2: v2(13.2,76.92) v2(13.2,58.51) v2(13.2,43.65) 13.2,42.76 18.42,37.55 v2(18.42,26.06)
  Bottom Layer w0.254: 18.92,6.69 18.92,25.56 v2(18.42,26.06)
SW: length 6.3
  Top Layer w0.2: U1.6 34.66,46.85 R8.2 34.74,42.81 C20.2
SW1: length 21.6
  Top Layer w0.254: U2.18 62.84,15.01 63.92,16.09 C8.2 63.29,16.73 v1(63.29,16.73) ; R20.2 62.93,24.17 61.84,23.08 61,23.08 60.82,22.9 ; 60.82,22.9 59.78,21.86 ; 60.82,22.9 59.62,22.9 Q1.7 59.35,21.09 v1(61.51,21.09)
  Inner2 w0.254: v1(63.29,16.73) 61.51,18.5 v1(61.51,21.09)
SW2: length 6.2
  Top Layer w0.2: U11.6 34.03,65.5 33.78,65.25 R23.2 35.23,60.81 C39.2
VDRV: length 3.5
  Top Layer w0.2: C21.2 37.2,43.4 37.2,45.98
VDRV2: length 2.4
  Top Layer w0.2: C40.2 37.21,62.52 U11.10

## Copper pours and planes (outline as drawn; the poured copper is in the pictures)
GND on Top Layer: -2.22,87 153.78,87 153.78,-3 -2.22,-3
GND on Bottom Layer: -2.22,87 153.78,87 153.78,-3 -2.22,-3
GND on Inner1: 1.03,83.74 150.52,83.74 150.52,0.26 1.03,0.26
GND on Inner2: -2.22,87 153.78,87 153.78,-3 -2.22,-3
VBUSA1 on Top Layer: 11.66,26.38 15.35,26.38 15.35,24.22 11.66,24.22
VBUSC on Top Layer: 10.51,51.27 13.46,51.27 13.46,46.75 10.51,46.75
VBUSC1 on Top Layer: 10.51,35.97 13.46,35.97 13.46,31.97 10.51,31.97
VBUSC2 on Top Layer: 10.49,69.68 13.46,69.68 13.46,62.91 10.49,62.91
VIN on Top Layer: 72.13,20.12 88.26,20.12 88.26,9.87 72.13,9.87
VIN2 on Top Layer: 41.98,77.4 44.18,77.4 44.18,75.21 41.98,75.21
VIN2 on Top Layer: 39.15,49.06 44.01,49.06 44.01,46.12 39.15,46.12
VIN2 on Top Layer: 39.15,67.64 45,67.64 45,64.71 39.15,64.71
VIN2 on Top Layer: 41.98,59.05 44.18,59.05 44.18,56.86 41.98,56.86
$Q4_1 on Top Layer: 15.82,36.09 23.73,36.09 23.73,18.24 15.82,18.24
$Q4_3 on Top Layer: 20.65,18.05 23.36,18.05 23.36,16.34 20.65,16.34
CSN on Top Layer: 15.29,51.27 18.22,51.27 18.22,49.11 15.29,49.11
CSN2 on Top Layer: 15.3,69.83 18.23,69.83 18.23,67.67 15.3,67.67
CSNA1 on Top Layer: 24.57,17.34 26.87,17.34 26.87,13.68 24.57,13.68
CSNC1 on Top Layer: 24.56,21.37 26.86,21.37 26.86,17.69 24.56,17.69
CSP on Top Layer: 18.76,51.05 25.35,51.05 25.35,44.6 18.76,44.6
CSP2 on Top Layer: 18.76,69.61 25.36,69.61 25.36,63.16 18.76,63.16
CSPA1 on Top Layer: 28.63,20.82 45.14,20.82 45.14,14.22 28.63,14.22
SW on Top Layer: 31.11,49.07 35,49.07 35,46.8 31.11,46.8
SW1 on Top Layer: 51.55,23.16 56.25,23.16 56.25,16.22 51.55,16.22
SW2 on Top Layer: 31.11,67.63 35.01,67.63 35.01,65.36 31.11,65.36

Small or netless copper shapes (teardrops, artwork), in the pictures only: 247 on Top Layer, 54 on Bottom Layer, 122 on Inner1, 20 on Inner2

## Text on the board
Top Silkscreen Layer: AC 220V IN | DC OUT | N | L | CP-03x | 140W+65W+65W / 四路彩屏多协议快充电源 | 地 | 开关 | Charging Station | 300W
